# Altium schematic sheet schematic.SchDoc
size A3
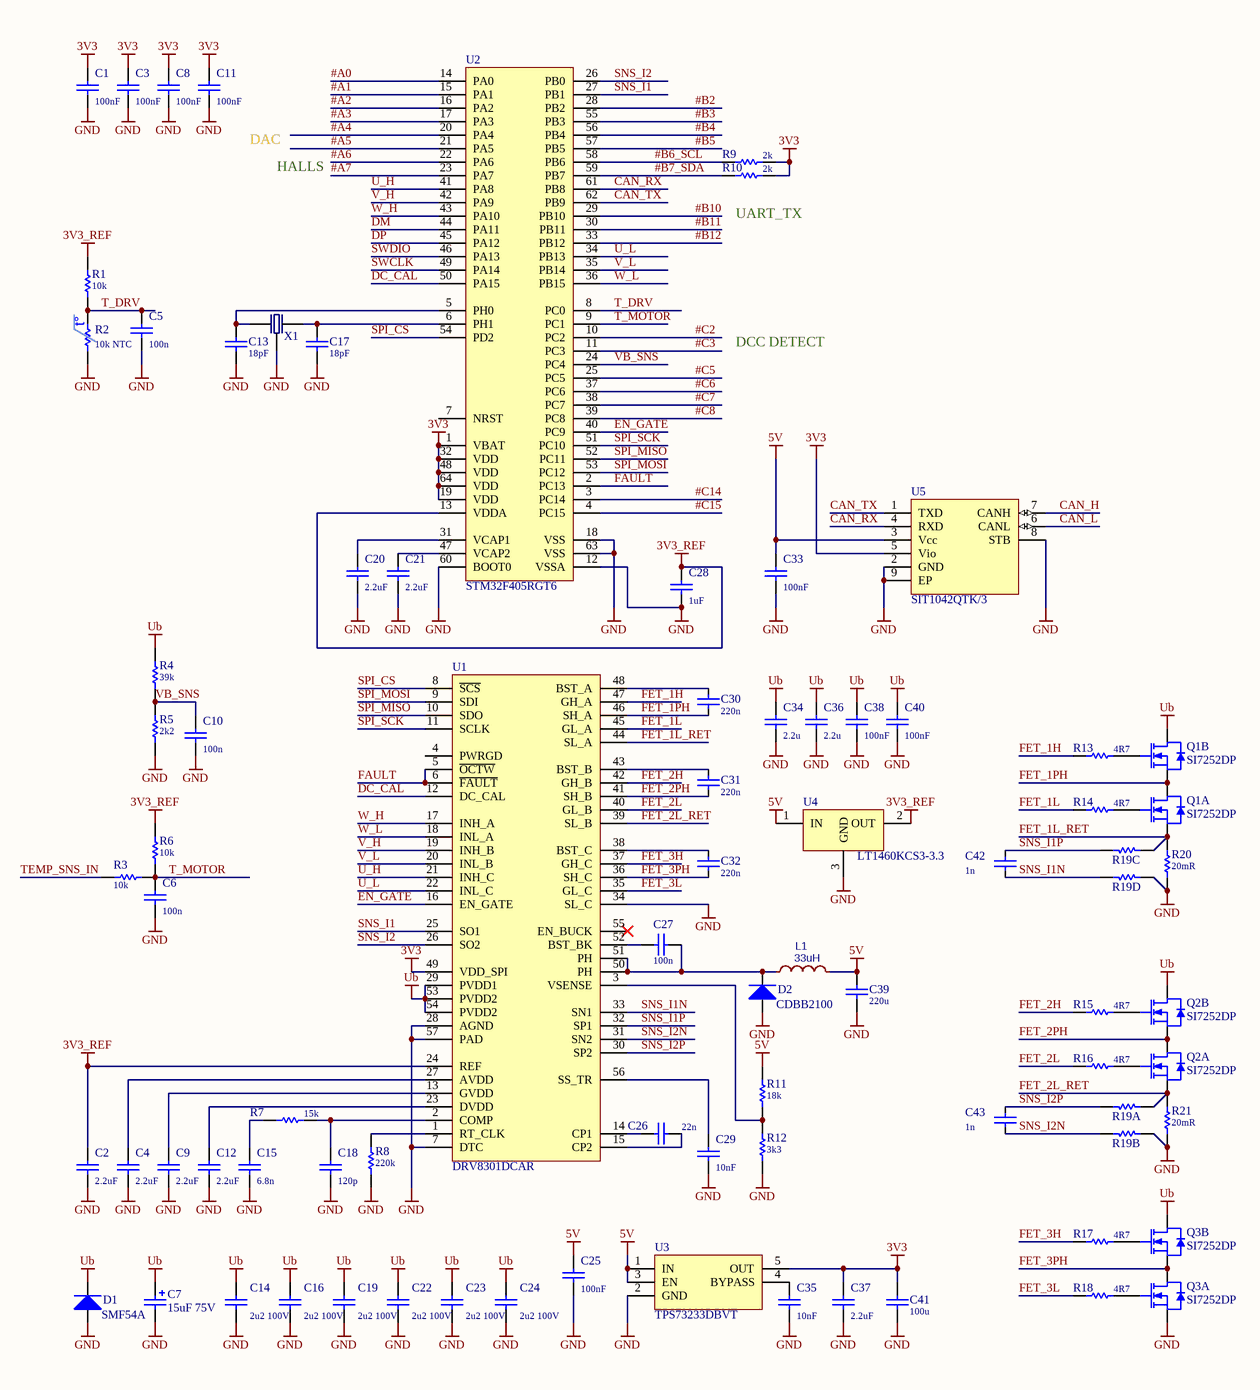
[diagram p0: schematic.SchDoc]

## Parts
C1  100nF  [C0402]
C2  2.2uF  [C0603]
C3  100nF  [C0402]
C4  2.2uF  [C0402]
C5  100n  [C0402]
C6  100n  [C0402]
C7  15uF 75V  [RR_7343]
C8  100nF  [C0402]
C9  2.2uF  [C0603]
C10  100n  [C0402]
C11  100nF  [C0402]
C12  2.2uF  [C0603]
C13  18pF  [C0402]
C14  2u2 100V  [C1210-1.8MM]
C15  6.8n  [C0402]
C16  2u2 100V  [C1210-1.8MM]
C17  18pF  [C0402]
C18  120p  [C0402]
C19  2u2 100V  [C1210-1.8MM]
C20  2.2uF  [C0603]
C21  2.2uF  [C0603]
C22  2u2 100V  [C1210-1.8MM]
C23  2u2 100V  [C1210-1.8MM]
C24  2u2 100V  [C1210-1.8MM]
C25  100nF  [C0402]
C26  22n  [C0402]
C27  100n  [C0402]
C28  1uF  [C0402]
C29  10nF  [C0402]
C30  220n  [C0402]
C31  220n  [C0402]
C32  220n  [C0402]
C33  100nF  [C0402]
C34  2.2u  [C1206]
C35  10nF  [C0402]
C36  2.2u  [C1206]
C37  2.2uF  [C0603]
C38  100nF  [C0805]
C39  220u  [C6028]
C40  100nF  [C0805]
C41  100u  [C3528]
C42  1n  [C0402]
C43  1n  [C0402]
D1  SMF54A  [SMB]
D2  CDBB2100  [SMB]
L1  33uH  [RR_IND_DR74]
Q1  SI7252DP  [PQFN_5X6]  (parts A,B of 2)
Q2  SI7252DP  [PQFN_5X6]  (parts A,B of 2)
Q3  SI7252DP  [PQFN_5X6]  (parts A,B of 2)
R1  10k  [R0402]
R2  10k NTC  [R0402]
R3  10k  [R0402]
R4  39k  [R0603]
R5  2k2  [R0402]
R6  10k  [R0402]
R7  15k  [R0402]
R8  220k  [R0402]
R9  2k  [R0402]
R10  2k  [R0402]
R11  18k  [R0402]
R12  3k3  [R0402]
R13  4R7  [R0402]
R14  4R7  [R0402]
R15  4R7  [R0402]
R16  4R7  [R0402]
R17  4R7  [R0402]
R18  4R7  [R0402]
R19  100  [RR_1206_ARRAY_4X]  (value not drawn)  (parts A,B,C,D of 4)
R20  20mR  [R1206]
R21  20mR  [R1206]
U1  DRV8301DCAR  [RR_HTSSOP56]
U2  STM32F405RGT6  [LQFP-64]
U3  TPS73233DBVT  [SOT-23-5]
U4  LT1460KCS3-3.3  [SOT-23]
U5  SIT1042QTK/3  [DFN8_3X3_P065]
X1  CSTCE8M00G55-R0  [RR_CRYSTAL_3.2X1.3]  (value not drawn)

## Nets
3V3: C1.2 C3.2 C8.2 C11.2 C37.2 C41.2 R9.2 R10.2 U1.49(VDD_SPI) U2.1(VBAT) U2.19(VDD) U2.32(VDD) U2.48(VDD) U2.64(VDD) U3.5(OUT) U5.5(Vio)
3V3_REF: C2.2 C28.2 R1.1 R6.1 U1.24(REF) U2.13(VDDA) U4.2(OUT)
5V: C25.2 C33.2 C39.2 L1.2 R11.2 U3.1(IN) U3.3(EN) U4.1(IN) U5.3(Vcc)
GND: C1.1 C2.1 C3.1 C4.1 C5.1 C6.1 C7.2 C8.1 C9.1 C10.1 C11.1 C12.1 C13.1 C14.1 C15.1 C16.1 C17.1 C18.1 C19.1 C20.1 C21.1 C22.1 C23.1 C24.1 C25.1 C28.1 C29.1 C33.1 C34.1 C35.1 C36.1 C37.1 C38.1 C39.1 C40.1 C41.1 D1.1(A) D2.1(A) Q3.1(S1) R2.2 R5.1 R8.1 R12.1 R19.4 R19.8 R20.1 R21.1 U1.7(DTC) U1.28(AGND) U1.34(SL_C) U1.57(PAD) U2.12(VSSA) U2.18(VSS) U2.60(BOOT0) U2.63(VSS) U3.2(GND) U4.3(GND) U5.2(GND) U5.8(STB) U5.9(EP) X1.2(GND)
Ub: C7.1 C14.2 C16.2 C19.2 C22.2 C23.2 C24.2 C34.2 C36.2 C38.2 C40.2 D1.2(K) Q1.5,6(D) Q2.5,6(D) Q3.5,6(D) R4.2 U1.29(PVDD1) U1.53(PVDD2) U1.54(PVDD2)
#A0: U2.14(PA0)
#A1: U2.15(PA1)
#A2: U2.16(PA2)
#A3: U2.17(PA3)
#A4: U2.20(PA4)
#A5: U2.21(PA5)
#A6: U2.22(PA6)
#A7: U2.23(PA7)
#B2: U2.28(PB2)
#B3: U2.55(PB3)
#B4: U2.56(PB4)
#B5: U2.57(PB5)
#B6_SCL: R9.1 U2.58(PB6)
#B7_SDA: R10.1 U2.59(PB7)
#B10: U2.29(PB10)
#B11: U2.30(PB11)
#B12: U2.33(PB12)
#C2: U2.10(PC2)
#C3: U2.11(PC3)
#C5: U2.25(PC5)
#C6: U2.37(PC6)
#C7: U2.38(PC7)
#C8: U2.39(PC8)
#C14: U2.3(PC14)
#C15: U2.4(PC15)
CAN_H: U5.7(CANH)
CAN_L: U5.6(CANL)
CAN_RX: U2.61(PB8) U5.4(RXD)
CAN_TX: U2.62(PB9) U5.1(TXD)
DC_CAL: U1.12(DC_CAL) U2.50(PA15)
DM: U2.44(PA11)
DP: U2.45(PA12)
EN_GATE: U1.16(EN_GATE) U2.40(PC9)
FAULT: U1.5(~{OCTW}) U1.6(~{FAULT}) U2.2(PC13)
FET_1H: R13.1 U1.47(GH_A)
FET_1L: R14.1 U1.45(GL_A)
FET_1L_RET: Q1.1(S1) R19.6 R20.2 U1.44(SL_A)
FET_1PH: C30.1 Q1.3(S2) Q1.7,8(D1) U1.46(SH_A)
FET_2H: R15.1 U1.42(GH_B)
FET_2L: R16.1 U1.40(GL_B)
FET_2L_RET: Q2.1(S1) R19.2 R21.2 U1.39(SL_B)
FET_2PH: C31.1 Q2.3(S2) Q2.7,8(D1) U1.41(SH_B)
FET_3H: R17.1 U1.37(GH_C)
FET_3L: R18.1 U1.35(GL_C)
FET_3PH: C32.1 Q3.3(S2) Q3.7,8(D1) U1.36(SH_C)
SNS_I1: U1.25(SO1) U2.27(PB1)
SNS_I1N: C42.2 R19.7 U1.33(SN1)
SNS_I1P: C42.1 R19.5 U1.32(SP1)
SNS_I2: U1.26(SO2) U2.26(PB0)
SNS_I2N: C43.2 R19.3 U1.31(SN2)
SNS_I2P: C43.1 R19.1 U1.30(SP2)
SPI_CS: U1.8(~{SCS}) U2.54(PD2)
SPI_MISO: U1.10(SDO) U2.52(PC11)
SPI_MOSI: U1.9(SDI) U2.53(PC12)
SPI_SCK: U1.11(SCLK) U2.51(PC10)
SWCLK: U2.49(PA14)
SWDIO: U2.46(PA13)
T_DRV: C5.2 R1.2 R2.1 U2.8(PC0)
T_MOTOR: C6.2 R3.1 R6.2 U2.9(PC1)
TEMP_SNS_IN: R3.2
U_H: U1.21(INH_C) U2.41(PA8)
U_L: U1.22(INL_C) U2.34(PB13)
V_H: U1.19(INH_B) U2.42(PA9)
V_L: U1.20(INL_B) U2.35(PB14)
VB_SNS: C10.2 R4.1 R5.2 U2.24(PC4)
W_H: U1.17(INH_A) U2.43(PA10)
W_L: U1.18(INL_A) U2.36(PB15)
NetC4_2: C4.2 U1.27(AVDD)
NetC9_2: C9.2 U1.13(GVDD)
NetC12_2: C12.2 U1.23(DVDD)
NetC13_2: C13.2 U2.5(PH0) X1.1(X1)
NetC15_2: C15.2 R7.2
NetC17_2: C17.2 U2.6(PH1) X1.3(X2)
NetC18_2: C18.2 R7.1 U1.2(COMP)
NetC20_2: C20.2 U2.31(VCAP1)
NetC21_2: C21.2 U2.47(VCAP2)
NetC26_1: C26.1 U1.14(CP1)
NetC26_2: C26.2 U1.15(CP2)
NetC27_1: C27.1 D2.2(K) L1.1 U1.50(PH) U1.51(PH)
NetC27_2: C27.2 U1.52(BST_BK)
NetC29_2: C29.2 U1.56(SS_TR)
NetC30_2: C30.2 U1.48(BST_A)
NetC31_2: C31.2 U1.43(BST_B)
NetC32_2: C32.2 U1.38(BST_C)
NetC35_2: C35.2 U3.4(BYPASS)
NetQ1_2: Q1.2(G1) R14.2
NetQ1_4: Q1.4(G2) R13.2
NetQ2_2: Q2.2(G1) R16.2
NetQ2_4: Q2.4(G2) R15.2
NetQ3_2: Q3.2(G1) R18.2
NetQ3_4: Q3.4(G2) R17.2
NetR8_2: R8.2 U1.1(RT_CLK)
NetR11_1: R11.1 R12.2 U1.3(VSENSE)

Not connected (* = marked no-connect by the designer): U1 4(PWRGD) 55(EN_BUCK)*; U2 7(NRST)

## Notes on the sheet
- DAC
- HALLS
- UART_TX
- DCC DETECT
- (in symbol RES) t°

## Library data of the parts
C1-C4 C8 C9 C11 C12 C15 C18 C25 C27 C29 C35 C37 C38 C40 = CAP: 100nF 0402
C5 C6 C10 C34 C36 = CAP
C7 = Cap Pol2: Polarized Capacitor (Axial); Value: CAP TANT POLY 15UF 75V 7343 75mOhm; Order Number: T521X156M075ATE0357280; Published: 8-Jun-2000; LatestRevisionDate: 17-Jul-2002; LatestRevisionNote: Re-released for DXP Platform.; Publisher: Altium Limited; PackageDescription: Polarized Capacitor; 2 Leads; Distributor: KEMET; Package: X
C13 C17 = CAP: 18pF 0402
C14 C16 C19 C22-C24 = CAP: 2u2 100V 1210; P/N: HMK325B7225KN-T; LCSC part number: C92775
C20 C21 = CAP: 2.2uF 0603
C26 C30-C32 C39 C41-C43 = CAP: P/N: 0402B104K250NT; LCSC part number: C56392
C28 = CAP: 1uF 0603
C33 = CAP: 100nF 50V 0402; P/N: 0402B104K500NT; LCSC part number: C110251
D1 = Diode: Default Diode; Value: TVS DIODE 54VWM 87.1VC SOD123F; Distributor: Littelfuse Inc.; Order Number: SMF54A; Package: SOD123F
D2 = Diode: Default Diode; Value: TVS DIODE 54VWM 87.1VC SOD123F; Order Number: SMF54A; Distributor: Littelfuse Inc.; Package: SOD123F
L1 = 4.7uH: P/N: FXL0420-4R7-M; LCSC part number: C167208
Q1-Q3 = SI7252DP-T1-GE3
R1 R3-R8 R11 R12 = RES
R2 = RES: 10k NTC 3380K 0402; P/N: NCP15XH103F03RC; LCSC part number: C77131
R9 R10 R19 = RES: P/N: RC0402FR-0730RL; LCSC part number: C138007
R13-R18 = RES: 4R7 0402; P/N: RC0402FR-0730RL; LCSC part number: C138007
R20 R21 = RES: 5mR shunt 2512
U1 = DRV8301: Value: DRV 8301 - IC MOTOR CONTROLLER SPI 56HTSSOP; Distributor: Texas Instruments; Order Number: DRV8301DCAR; Package: HTSSOP56
U2 = STM32F405: STM32 ARM-based 32-bit MCU
U3 = TPS7xx33: Value: LDO 3.3V 250mA; Order Number: TPS73233DBVT; Distributor: Texas Instruments; Package: SOT23-5
U4 = NCP51460SN33T1G: REF3033AIDBZR; LCSC part number: C36658; P/N: REF3033AIDBZR
U5 = LTC2875: IC INTERFACE CAN; LCSC part number: C5308062; P/N: SIT1042QTK/3
X1 = CRYSTAL_3P: Value: CER RES 8.0000MHZ 33PF SMD; Order Number: CSTCE8M00G55-R0; Distributor: Murata Electronics; Package: 3-SMD, Non-Standard